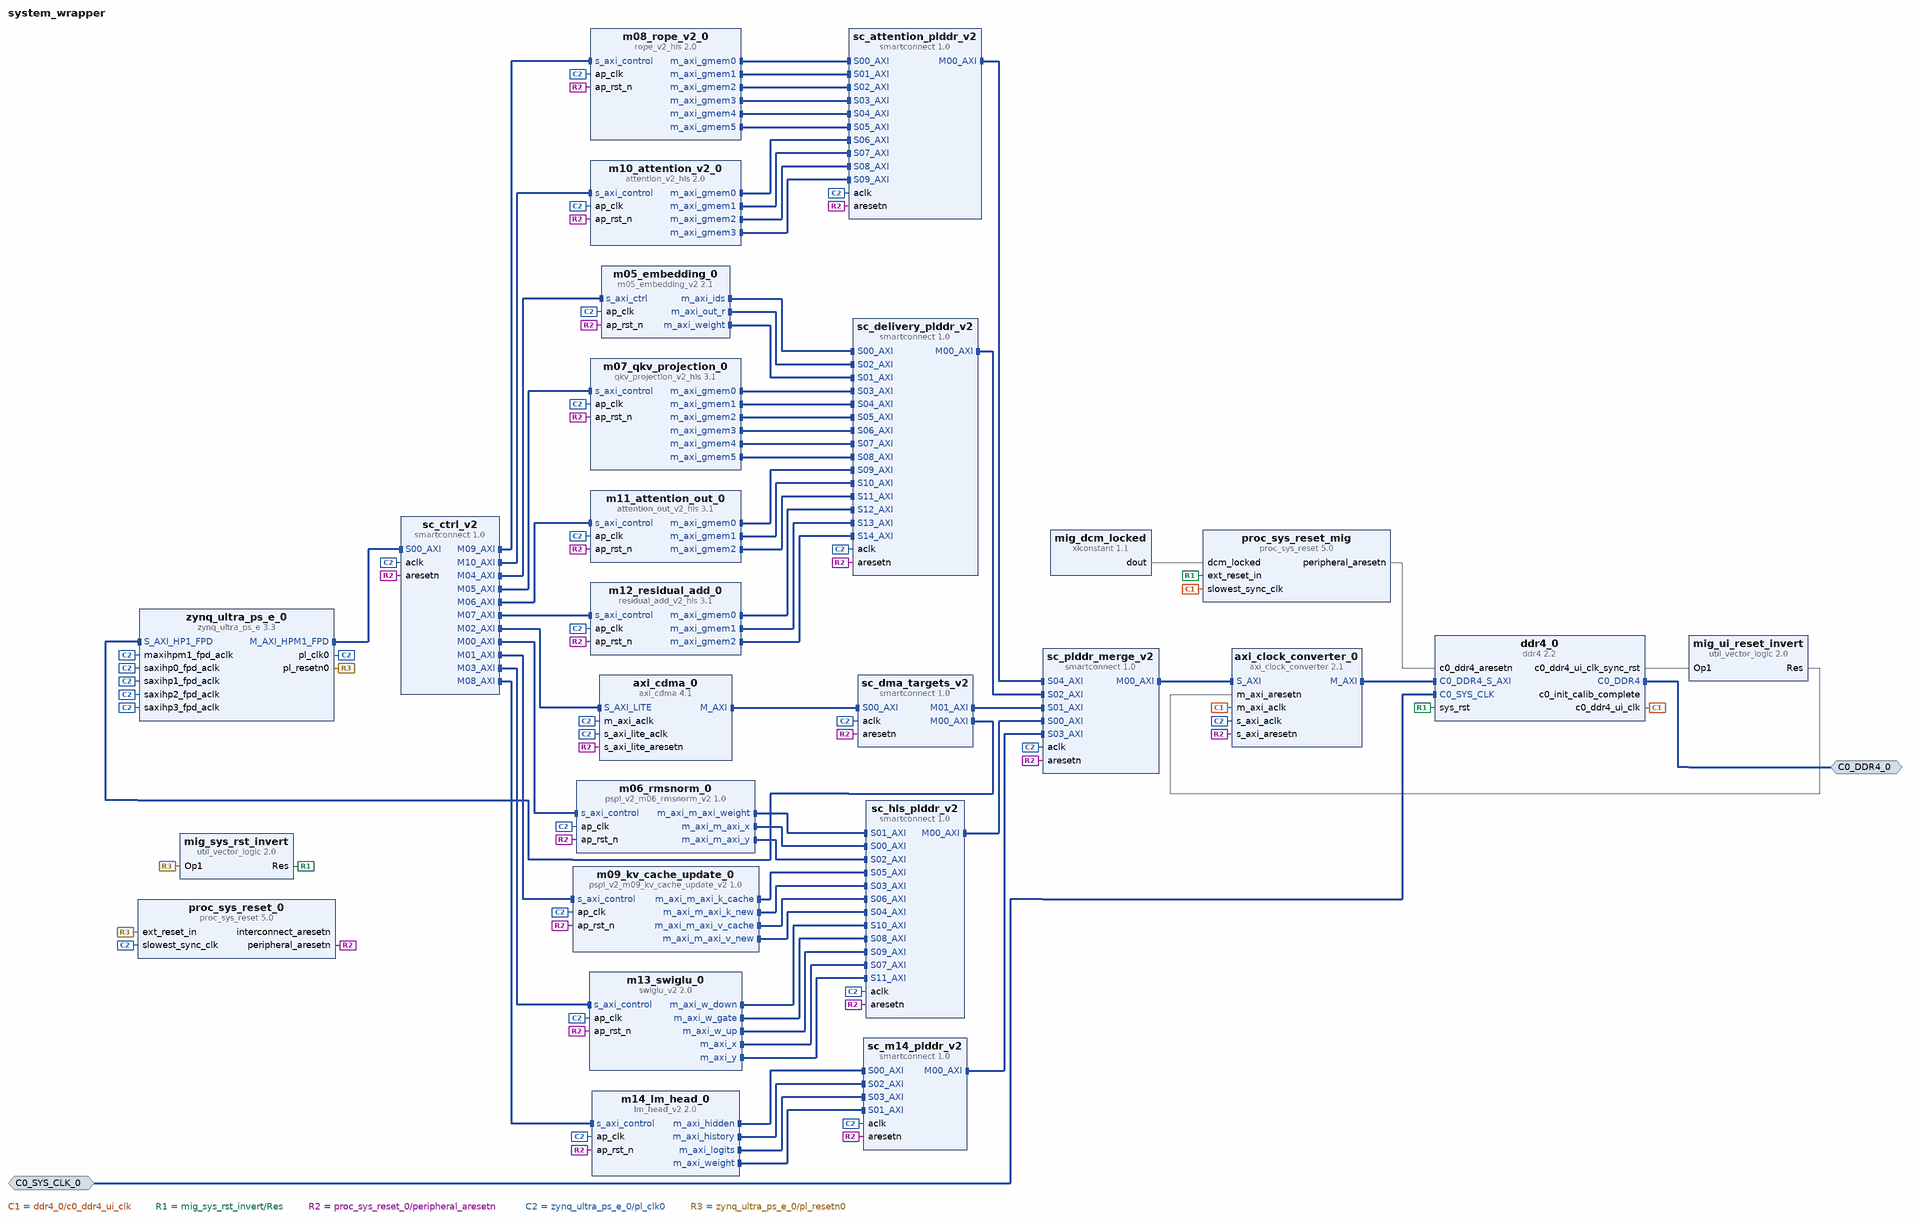
[diagram p0: block diagram of the top level]
# Vivado block design system_wrapper, xczu9eg-ffvb1156-2-i, Vivado 2021.1
create_bd_design system_wrapper

create_bd_intf_port -mode Slave -vlnv xilinx.com:interface:diff_clock_rtl:1.0 C0_SYS_CLK_0
set_property -dict {CONFIG.FREQ_HZ 200000000} [get_bd_intf_ports C0_SYS_CLK_0]
create_bd_intf_port -mode Master -vlnv xilinx.com:interface:ddr4_rtl:1.0 C0_DDR4_0

create_bd_cell -type ip -vlnv xilinx.com:ip:zynq_ultra_ps_e:3.3 zynq_ultra_ps_e_0
set_property -dict [list \
  CONFIG.CAN0_BOARD_INTERFACE custom \
  CONFIG.CAN1_BOARD_INTERFACE custom \
  CONFIG.CSU_BOARD_INTERFACE custom \
  CONFIG.DP_BOARD_INTERFACE custom \
  CONFIG.GEM0_BOARD_INTERFACE custom \
  CONFIG.GEM1_BOARD_INTERFACE custom \
  CONFIG.GEM2_BOARD_INTERFACE custom \
  CONFIG.GEM3_BOARD_INTERFACE custom \
  CONFIG.GPIO_BOARD_INTERFACE custom \
  CONFIG.IIC0_BOARD_INTERFACE custom \
  CONFIG.IIC1_BOARD_INTERFACE custom \
  CONFIG.NAND_BOARD_INTERFACE custom \
  CONFIG.PCIE_BOARD_INTERFACE custom \
  CONFIG.PJTAG_BOARD_INTERFACE custom \
  CONFIG.PMU_BOARD_INTERFACE custom \
  CONFIG.PSU_BANK_0_IO_STANDARD LVCMOS18 \
  CONFIG.PSU_BANK_1_IO_STANDARD LVCMOS18 \
  CONFIG.PSU_BANK_2_IO_STANDARD LVCMOS18 \
  CONFIG.PSU_BANK_3_IO_STANDARD LVCMOS33 \
  CONFIG.PSU_USB3__DUAL_CLOCK_ENABLE 0 \
  CONFIG.PSU__CAN1__PERIPHERAL__ENABLE 0 \
  CONFIG.PSU__CRF_APB__ACPU_CTRL__FREQMHZ 1333.333 \
  CONFIG.PSU__CRF_APB__ACPU_CTRL__SRCSEL APLL \
  CONFIG.PSU__CRF_APB__APLL_CTRL__SRCSEL PSS_REF_CLK \
  CONFIG.PSU__CRF_APB__DBG_FPD_CTRL__FREQMHZ 250 \
  CONFIG.PSU__CRF_APB__DBG_FPD_CTRL__SRCSEL IOPLL \
  CONFIG.PSU__CRF_APB__DBG_TRACE_CTRL__FREQMHZ 250 \
  CONFIG.PSU__CRF_APB__DBG_TRACE_CTRL__SRCSEL IOPLL \
  CONFIG.PSU__CRF_APB__DBG_TSTMP_CTRL__FREQMHZ 250 \
  CONFIG.PSU__CRF_APB__DBG_TSTMP_CTRL__SRCSEL IOPLL \
  CONFIG.PSU__CRF_APB__DDR_CTRL__FREQMHZ 800 \
  CONFIG.PSU__CRF_APB__DDR_CTRL__SRCSEL DPLL \
  CONFIG.PSU__CRF_APB__DPDMA_REF_CTRL__FREQMHZ 600 \
  CONFIG.PSU__CRF_APB__DPDMA_REF_CTRL__SRCSEL DPLL \
  CONFIG.PSU__CRF_APB__DPLL_CTRL__SRCSEL PSS_REF_CLK \
  CONFIG.PSU__CRF_APB__DP_AUDIO_REF_CTRL__SRCSEL VPLL \
  CONFIG.PSU__CRF_APB__DP_STC_REF_CTRL__SRCSEL VPLL \
  CONFIG.PSU__CRF_APB__DP_VIDEO_REF_CTRL__SRCSEL DPLL \
  CONFIG.PSU__CRF_APB__GDMA_REF_CTRL__FREQMHZ 600 \
  CONFIG.PSU__CRF_APB__GDMA_REF_CTRL__SRCSEL DPLL \
  CONFIG.PSU__CRF_APB__GPU_REF_CTRL__FREQMHZ 600 \
  CONFIG.PSU__CRF_APB__GPU_REF_CTRL__SRCSEL DPLL \
  CONFIG.PSU__CRF_APB__TOPSW_LSBUS_CTRL__FREQMHZ 100 \
  CONFIG.PSU__CRF_APB__TOPSW_LSBUS_CTRL__SRCSEL IOPLL \
  CONFIG.PSU__CRF_APB__TOPSW_MAIN_CTRL__FREQMHZ 533.333 \
  CONFIG.PSU__CRF_APB__TOPSW_MAIN_CTRL__SRCSEL VPLL \
  CONFIG.PSU__CRF_APB__VPLL_CTRL__SRCSEL PSS_REF_CLK \
  CONFIG.PSU__CRL_APB__ADMA_REF_CTRL__FREQMHZ 533.333 \
  CONFIG.PSU__CRL_APB__ADMA_REF_CTRL__SRCSEL RPLL \
  CONFIG.PSU__CRL_APB__CAN1_REF_CTRL__FREQMHZ 100 \
  CONFIG.PSU__CRL_APB__CAN1_REF_CTRL__SRCSEL IOPLL \
  CONFIG.PSU__CRL_APB__CPU_R5_CTRL__FREQMHZ 533.333 \
  CONFIG.PSU__CRL_APB__CPU_R5_CTRL__SRCSEL RPLL \
  CONFIG.PSU__CRL_APB__DBG_LPD_CTRL__FREQMHZ 250 \
  CONFIG.PSU__CRL_APB__DBG_LPD_CTRL__SRCSEL IOPLL \
  CONFIG.PSU__CRL_APB__GEM3_REF_CTRL__FREQMHZ 125 \
  CONFIG.PSU__CRL_APB__GEM3_REF_CTRL__SRCSEL IOPLL \
  CONFIG.PSU__CRL_APB__I2C0_REF_CTRL__FREQMHZ 100 \
  CONFIG.PSU__CRL_APB__I2C0_REF_CTRL__SRCSEL IOPLL \
  CONFIG.PSU__CRL_APB__I2C1_REF_CTRL__FREQMHZ 100 \
  CONFIG.PSU__CRL_APB__I2C1_REF_CTRL__SRCSEL IOPLL \
  CONFIG.PSU__CRL_APB__IOPLL_CTRL__SRCSEL PSS_REF_CLK \
  CONFIG.PSU__CRL_APB__IOU_SWITCH_CTRL__FREQMHZ 267 \
  CONFIG.PSU__CRL_APB__IOU_SWITCH_CTRL__SRCSEL RPLL \
  CONFIG.PSU__CRL_APB__LPD_LSBUS_CTRL__FREQMHZ 100 \
  CONFIG.PSU__CRL_APB__LPD_LSBUS_CTRL__SRCSEL IOPLL \
  CONFIG.PSU__CRL_APB__LPD_SWITCH_CTRL__FREQMHZ 533.333 \
  CONFIG.PSU__CRL_APB__LPD_SWITCH_CTRL__SRCSEL RPLL \
  CONFIG.PSU__CRL_APB__PCAP_CTRL__FREQMHZ 200 \
  CONFIG.PSU__CRL_APB__PCAP_CTRL__SRCSEL IOPLL \
  CONFIG.PSU__CRL_APB__PL0_REF_CTRL__FREQMHZ 100 \
  CONFIG.PSU__CRL_APB__PL0_REF_CTRL__SRCSEL DPLL \
  CONFIG.PSU__CRL_APB__QSPI_REF_CTRL__FREQMHZ 300 \
  CONFIG.PSU__CRL_APB__QSPI_REF_CTRL__SRCSEL IOPLL \
  CONFIG.PSU__CRL_APB__RPLL_CTRL__SRCSEL PSS_REF_CLK \
  CONFIG.PSU__CRL_APB__SDIO1_REF_CTRL__FREQMHZ 200 \
  CONFIG.PSU__CRL_APB__SDIO1_REF_CTRL__SRCSEL RPLL \
  CONFIG.PSU__CRL_APB__TIMESTAMP_REF_CTRL__FREQMHZ 100 \
  CONFIG.PSU__CRL_APB__TIMESTAMP_REF_CTRL__SRCSEL PSS_REF_CLK \
  CONFIG.PSU__CRL_APB__UART0_REF_CTRL__FREQMHZ 100 \
  CONFIG.PSU__CRL_APB__UART0_REF_CTRL__SRCSEL IOPLL \
  CONFIG.PSU__CRL_APB__UART1_REF_CTRL__FREQMHZ 100 \
  CONFIG.PSU__CRL_APB__UART1_REF_CTRL__SRCSEL IOPLL \
  CONFIG.PSU__CRL_APB__USB0_BUS_REF_CTRL__FREQMHZ 250 \
  CONFIG.PSU__CRL_APB__USB0_BUS_REF_CTRL__SRCSEL IOPLL \
  CONFIG.PSU__CRL_APB__USB3_DUAL_REF_CTRL__FREQMHZ 20 \
  CONFIG.PSU__CRL_APB__USB3_DUAL_REF_CTRL__SRCSEL IOPLL \
  CONFIG.PSU__CRL_APB__USB3__ENABLE 0 \
  CONFIG.PSU__CSUPMU__PERIPHERAL__VALID 0 \
  CONFIG.PSU__DDRC__BUS_WIDTH {64 Bit} \
  CONFIG.PSU__DDRC__COMPONENTS Components \
  CONFIG.PSU__DDRC__DEVICE_CAPACITY {8192 MBits} \
  CONFIG.PSU__DDRC__DRAM_WIDTH {16 Bits} \
  CONFIG.PSU__DDRC__ECC Disabled \
  CONFIG.PSU__DDRC__MEMORY_TYPE {DDR 4} \
  CONFIG.PSU__DDRC__SPEED_BIN DDR4_1600J \
  CONFIG.PSU__DDR_HIGH_ADDRESS_GUI_ENABLE 1 \
  CONFIG.PSU__DDR__INTERFACE__FREQMHZ 400.000 \
  CONFIG.PSU__DEVICE_TYPE EG \
  CONFIG.PSU__DISPLAYPORT__PERIPHERAL__ENABLE 0 \
  CONFIG.PSU__DLL__ISUSED 1 \
  CONFIG.PSU__ENET3__FIFO__ENABLE 0 \
  CONFIG.PSU__ENET3__GRP_MDIO__ENABLE 1 \
  CONFIG.PSU__ENET3__GRP_MDIO__IO {MIO 76 .. 77} \
  CONFIG.PSU__ENET3__PERIPHERAL__ENABLE 1 \
  CONFIG.PSU__ENET3__PERIPHERAL__IO {MIO 64 .. 75} \
  CONFIG.PSU__ENET3__PTP__ENABLE 0 \
  CONFIG.PSU__ENET3__TSU__ENABLE 0 \
  CONFIG.PSU__FPD_SLCR__WDT1__FREQMHZ 100 \
  CONFIG.PSU__FPGA_PL0_ENABLE 1 \
  CONFIG.PSU__GEM3_COHERENCY 0 \
  CONFIG.PSU__GEM3_ROUTE_THROUGH_FPD 0 \
  CONFIG.PSU__GEM__TSU__ENABLE 0 \
  CONFIG.PSU__GPIO0_MIO__PERIPHERAL__ENABLE 0 \
  CONFIG.PSU__GPIO1_MIO__PERIPHERAL__ENABLE 0 \
  CONFIG.PSU__I2C0__PERIPHERAL__ENABLE 0 \
  CONFIG.PSU__I2C1__PERIPHERAL__ENABLE 0 \
  CONFIG.PSU__IOU_SLCR__IOU_TTC_APB_CLK__TTC0_SEL APB \
  CONFIG.PSU__IOU_SLCR__IOU_TTC_APB_CLK__TTC1_SEL APB \
  CONFIG.PSU__IOU_SLCR__IOU_TTC_APB_CLK__TTC2_SEL APB \
  CONFIG.PSU__IOU_SLCR__IOU_TTC_APB_CLK__TTC3_SEL APB \
  CONFIG.PSU__IOU_SLCR__TTC1__FREQMHZ 100 \
  CONFIG.PSU__IOU_SLCR__TTC2__FREQMHZ 100 \
  CONFIG.PSU__IOU_SLCR__TTC3__FREQMHZ 100 \
  CONFIG.PSU__IOU_SLCR__WDT0__FREQMHZ 100 \
  CONFIG.PSU__LPD_SLCR__CSUPMU__FREQMHZ 100 \
  CONFIG.PSU__OVERRIDE_HPX_QOS 0 \
  CONFIG.PSU__OVERRIDE__BASIC_CLOCK 0 \
  CONFIG.PSU__PMU__PERIPHERAL__ENABLE 0 \
  CONFIG.PSU__PRESET_APPLIED 0 \
  CONFIG.PSU__PSS_REF_CLK__FREQMHZ 33.333 \
  CONFIG.PSU__QSPI__PERIPHERAL__ENABLE 0 \
  CONFIG.PSU__SATA__PERIPHERAL__ENABLE 0 \
  CONFIG.PSU__SD1_COHERENCY 0 \
  CONFIG.PSU__SD1_ROUTE_THROUGH_FPD 0 \
  CONFIG.PSU__SD1__DATA_TRANSFER_MODE 4Bit \
  CONFIG.PSU__SD1__GRP_CD__ENABLE 0 \
  CONFIG.PSU__SD1__GRP_POW__ENABLE 0 \
  CONFIG.PSU__SD1__GRP_WP__ENABLE 0 \
  CONFIG.PSU__SD1__PERIPHERAL__ENABLE 1 \
  CONFIG.PSU__SD1__PERIPHERAL__IO {MIO 46 .. 51} \
  CONFIG.PSU__SD1__SLOT_TYPE {SD 2.0} \
  CONFIG.PSU__SWDT0__PERIPHERAL__ENABLE 0 \
  CONFIG.PSU__SWDT1__PERIPHERAL__ENABLE 0 \
  CONFIG.PSU__TSU__BUFG_PORT_PAIR 0 \
  CONFIG.PSU__TTC0__CLOCK__ENABLE 0 \
  CONFIG.PSU__TTC0__PERIPHERAL__ENABLE 1 \
  CONFIG.PSU__TTC0__WAVEOUT__ENABLE 0 \
  CONFIG.PSU__TTC1__PERIPHERAL__ENABLE 0 \
  CONFIG.PSU__TTC2__PERIPHERAL__ENABLE 0 \
  CONFIG.PSU__TTC3__PERIPHERAL__ENABLE 0 \
  CONFIG.PSU__UART0__PERIPHERAL__ENABLE 0 \
  CONFIG.PSU__UART1__PERIPHERAL__ENABLE 0 \
  CONFIG.PSU__USB0__PERIPHERAL__ENABLE 0 \
  CONFIG.PSU__USE__IRQ0 0 \
  CONFIG.PSU__USE__M_AXI_GP0 0 \
  CONFIG.PSU__USE__M_AXI_GP1 1 \
  CONFIG.PSU__USE__M_AXI_GP2 0 \
  CONFIG.PSU__USE__S_AXI_GP2 1 \
  CONFIG.PSU__USE__S_AXI_GP3 1 \
  CONFIG.PSU__USE__S_AXI_GP4 1 \
  CONFIG.PSU__USE__S_AXI_GP5 1 \
  CONFIG.QSPI_BOARD_INTERFACE custom \
  CONFIG.SATA_BOARD_INTERFACE custom \
  CONFIG.SD0_BOARD_INTERFACE custom \
  CONFIG.SD1_BOARD_INTERFACE custom \
  CONFIG.SPI0_BOARD_INTERFACE custom \
  CONFIG.SPI1_BOARD_INTERFACE custom \
  CONFIG.SUBPRESET1 Custom \
  CONFIG.SUBPRESET2 Custom \
  CONFIG.SWDT0_BOARD_INTERFACE custom \
  CONFIG.SWDT1_BOARD_INTERFACE custom \
  CONFIG.TRACE_BOARD_INTERFACE custom \
  CONFIG.TTC0_BOARD_INTERFACE custom \
  CONFIG.TTC1_BOARD_INTERFACE custom \
  CONFIG.TTC2_BOARD_INTERFACE custom \
  CONFIG.TTC3_BOARD_INTERFACE custom \
  CONFIG.UART0_BOARD_INTERFACE custom \
  CONFIG.UART1_BOARD_INTERFACE custom \
  CONFIG.USB0_BOARD_INTERFACE custom \
  CONFIG.USB1_BOARD_INTERFACE custom \
  CONFIG.preset None \
] [get_bd_cells zynq_ultra_ps_e_0]
# 738 more settings of zynq_ultra_ps_e_0 are not shown: defaults, MIO pin electricals, DDR timing, and values the tool derives
create_bd_cell -type ip -vlnv xilinx.com:ip:proc_sys_reset:5.0 proc_sys_reset_0
create_bd_cell -type ip -vlnv xilinx.com:ip:ddr4:2.2 ddr4_0
set_property -dict [list \
  CONFIG.C0.BANK_GROUP_WIDTH 1 \
  CONFIG.C0.DDR4_AxiAddressWidth 31 \
  CONFIG.C0.DDR4_AxiDataWidth 128 \
  CONFIG.C0.DDR4_CasLatency 15 \
  CONFIG.C0.DDR4_DataWidth 32 \
  CONFIG.C0.DDR4_InputClockPeriod 5003 \
  CONFIG.C0.DDR4_MemoryPart MT40A512M16LY-075 \
  CONFIG.C0.DDR4_TimePeriod 938 \
] [get_bd_cells ddr4_0]
create_bd_cell -type ip -vlnv xilinx.com:ip:axi_clock_converter:2.1 axi_clock_converter_0
create_bd_cell -type ip -vlnv xilinx.com:ip:util_vector_logic:2.0 mig_sys_rst_invert
set_property -dict {CONFIG.C_OPERATION not CONFIG.C_SIZE 1} [get_bd_cells mig_sys_rst_invert]
create_bd_cell -type ip -vlnv xilinx.com:ip:util_vector_logic:2.0 mig_ui_reset_invert
set_property -dict {CONFIG.C_OPERATION not CONFIG.C_SIZE 1} [get_bd_cells mig_ui_reset_invert]
create_bd_cell -type ip -vlnv xilinx.com:ip:proc_sys_reset:5.0 proc_sys_reset_mig
create_bd_cell -type ip -vlnv xilinx.com:ip:xlconstant:1.1 mig_dcm_locked
set_property -dict {CONFIG.CONST_VAL 1 CONFIG.CONST_WIDTH 1} [get_bd_cells mig_dcm_locked]
create_bd_cell -type ip -vlnv xilinx.com:ip:smartconnect:1.0 sc_ctrl_v2
set_property -dict {CONFIG.NUM_MI 11 CONFIG.NUM_SI 1} [get_bd_cells sc_ctrl_v2]
create_bd_cell -type ip -vlnv xilinx.com:ip:axi_cdma:4.1 axi_cdma_0
set_property -dict [list \
  CONFIG.C_ADDR_WIDTH 32 \
  CONFIG.C_INCLUDE_DRE 0 \
  CONFIG.C_INCLUDE_SG 0 \
  CONFIG.C_M_AXI_DATA_WIDTH 128 \
  CONFIG.C_M_AXI_MAX_BURST_LEN 64 \
] [get_bd_cells axi_cdma_0]
create_bd_cell -type ip -vlnv xilinx.com:ip:smartconnect:1.0 sc_dma_targets_v2
set_property -dict {CONFIG.NUM_MI 2 CONFIG.NUM_SI 1} [get_bd_cells sc_dma_targets_v2]
create_bd_cell -type ip -vlnv xilinx.com:ip:smartconnect:1.0 sc_hls_plddr_v2
set_property -dict {CONFIG.NUM_MI 1 CONFIG.NUM_SI 12} [get_bd_cells sc_hls_plddr_v2]
create_bd_cell -type ip -vlnv xilinx.com:ip:smartconnect:1.0 sc_plddr_merge_v2
set_property -dict {CONFIG.NUM_MI 1 CONFIG.NUM_SI 5} [get_bd_cells sc_plddr_merge_v2]
create_bd_cell -type ip -vlnv xilinx.com:hls:pspl_v2_m06_rmsnorm_v2:1.0 m06_rmsnorm_0
create_bd_cell -type ip -vlnv xilinx.com:hls:pspl_v2_m09_kv_cache_update_v2:1.0 m09_kv_cache_update_0
create_bd_cell -type ip -vlnv xilinx.com:ip:smartconnect:1.0 sc_delivery_plddr_v2
set_property -dict {CONFIG.NUM_MI 1 CONFIG.NUM_SI 15} [get_bd_cells sc_delivery_plddr_v2]
create_bd_cell -type ip -vlnv llm-fpga.local:user:m05_embedding_v2:2.1 m05_embedding_0
create_bd_cell -type ip -vlnv xilinx.com:hls:residual_add_v2_hls:3.1 m12_residual_add_0
create_bd_cell -type ip -vlnv xilinx.com:ip:smartconnect:1.0 sc_m14_plddr_v2
set_property -dict {CONFIG.NUM_MI 1 CONFIG.NUM_SI 4} [get_bd_cells sc_m14_plddr_v2]
create_bd_cell -type ip -vlnv user.org:llm_fpga:lm_head_v2:2.0 m14_lm_head_0
create_bd_cell -type ip -vlnv xilinx.com:hls:qkv_projection_v2_hls:3.1 m07_qkv_projection_0
create_bd_cell -type ip -vlnv xilinx.com:hls:attention_out_v2_hls:3.1 m11_attention_out_0
create_bd_cell -type ip -vlnv xilinx.com:ip:smartconnect:1.0 sc_attention_plddr_v2
set_property -dict {CONFIG.NUM_MI 1 CONFIG.NUM_SI 10} [get_bd_cells sc_attention_plddr_v2]
create_bd_cell -type ip -vlnv xilinx.com:hls:rope_v2_hls:2.0 m08_rope_v2_0
create_bd_cell -type ip -vlnv xilinx.com:hls:attention_v2_hls:2.0 m10_attention_v2_0
create_bd_cell -type ip -vlnv user.org:hls:swiglu_v2:2.0 m13_swiglu_0

# ---- connections ----

connect_bd_intf_net -intf_net C0_SYS_CLK_0_1 [get_bd_intf_ports C0_SYS_CLK_0] [get_bd_intf_pins ddr4_0/C0_SYS_CLK]
connect_bd_intf_net [get_bd_intf_pins axi_cdma_0/M_AXI] [get_bd_intf_pins sc_dma_targets_v2/S00_AXI]
connect_bd_intf_net [get_bd_intf_pins axi_clock_converter_0/M_AXI] [get_bd_intf_pins ddr4_0/C0_DDR4_S_AXI]
connect_bd_intf_net [get_bd_intf_ports C0_DDR4_0] [get_bd_intf_pins ddr4_0/C0_DDR4]
connect_bd_intf_net [get_bd_intf_pins m05_embedding_0/m_axi_ids] [get_bd_intf_pins sc_delivery_plddr_v2/S00_AXI]
connect_bd_intf_net [get_bd_intf_pins m05_embedding_0/m_axi_out_r] [get_bd_intf_pins sc_delivery_plddr_v2/S02_AXI]
connect_bd_intf_net [get_bd_intf_pins m05_embedding_0/m_axi_weight] [get_bd_intf_pins sc_delivery_plddr_v2/S01_AXI]
connect_bd_intf_net [get_bd_intf_pins m06_rmsnorm_0/m_axi_m_axi_weight] [get_bd_intf_pins sc_hls_plddr_v2/S01_AXI]
connect_bd_intf_net [get_bd_intf_pins m06_rmsnorm_0/m_axi_m_axi_x] [get_bd_intf_pins sc_hls_plddr_v2/S00_AXI]
connect_bd_intf_net [get_bd_intf_pins m06_rmsnorm_0/m_axi_m_axi_y] [get_bd_intf_pins sc_hls_plddr_v2/S02_AXI]
connect_bd_intf_net [get_bd_intf_pins m07_qkv_projection_0/m_axi_gmem0] [get_bd_intf_pins sc_delivery_plddr_v2/S03_AXI]
connect_bd_intf_net [get_bd_intf_pins m07_qkv_projection_0/m_axi_gmem1] [get_bd_intf_pins sc_delivery_plddr_v2/S04_AXI]
connect_bd_intf_net [get_bd_intf_pins m07_qkv_projection_0/m_axi_gmem2] [get_bd_intf_pins sc_delivery_plddr_v2/S05_AXI]
connect_bd_intf_net [get_bd_intf_pins m07_qkv_projection_0/m_axi_gmem3] [get_bd_intf_pins sc_delivery_plddr_v2/S06_AXI]
connect_bd_intf_net [get_bd_intf_pins m07_qkv_projection_0/m_axi_gmem4] [get_bd_intf_pins sc_delivery_plddr_v2/S07_AXI]
connect_bd_intf_net [get_bd_intf_pins m07_qkv_projection_0/m_axi_gmem5] [get_bd_intf_pins sc_delivery_plddr_v2/S08_AXI]
connect_bd_intf_net [get_bd_intf_pins m08_rope_v2_0/m_axi_gmem0] [get_bd_intf_pins sc_attention_plddr_v2/S00_AXI]
connect_bd_intf_net [get_bd_intf_pins m08_rope_v2_0/m_axi_gmem1] [get_bd_intf_pins sc_attention_plddr_v2/S01_AXI]
connect_bd_intf_net [get_bd_intf_pins m08_rope_v2_0/m_axi_gmem2] [get_bd_intf_pins sc_attention_plddr_v2/S02_AXI]
connect_bd_intf_net [get_bd_intf_pins m08_rope_v2_0/m_axi_gmem3] [get_bd_intf_pins sc_attention_plddr_v2/S03_AXI]
connect_bd_intf_net [get_bd_intf_pins m08_rope_v2_0/m_axi_gmem4] [get_bd_intf_pins sc_attention_plddr_v2/S04_AXI]
connect_bd_intf_net [get_bd_intf_pins m08_rope_v2_0/m_axi_gmem5] [get_bd_intf_pins sc_attention_plddr_v2/S05_AXI]
connect_bd_intf_net [get_bd_intf_pins m09_kv_cache_update_0/m_axi_m_axi_k_cache] [get_bd_intf_pins sc_hls_plddr_v2/S05_AXI]
connect_bd_intf_net [get_bd_intf_pins m09_kv_cache_update_0/m_axi_m_axi_k_new] [get_bd_intf_pins sc_hls_plddr_v2/S03_AXI]
connect_bd_intf_net [get_bd_intf_pins m09_kv_cache_update_0/m_axi_m_axi_v_cache] [get_bd_intf_pins sc_hls_plddr_v2/S06_AXI]
connect_bd_intf_net [get_bd_intf_pins m09_kv_cache_update_0/m_axi_m_axi_v_new] [get_bd_intf_pins sc_hls_plddr_v2/S04_AXI]
connect_bd_intf_net [get_bd_intf_pins m10_attention_v2_0/m_axi_gmem0] [get_bd_intf_pins sc_attention_plddr_v2/S06_AXI]
connect_bd_intf_net [get_bd_intf_pins m10_attention_v2_0/m_axi_gmem1] [get_bd_intf_pins sc_attention_plddr_v2/S07_AXI]
connect_bd_intf_net [get_bd_intf_pins m10_attention_v2_0/m_axi_gmem2] [get_bd_intf_pins sc_attention_plddr_v2/S08_AXI]
connect_bd_intf_net [get_bd_intf_pins m10_attention_v2_0/m_axi_gmem3] [get_bd_intf_pins sc_attention_plddr_v2/S09_AXI]
connect_bd_intf_net [get_bd_intf_pins m11_attention_out_0/m_axi_gmem0] [get_bd_intf_pins sc_delivery_plddr_v2/S09_AXI]
connect_bd_intf_net [get_bd_intf_pins m11_attention_out_0/m_axi_gmem1] [get_bd_intf_pins sc_delivery_plddr_v2/S10_AXI]
connect_bd_intf_net [get_bd_intf_pins m11_attention_out_0/m_axi_gmem2] [get_bd_intf_pins sc_delivery_plddr_v2/S11_AXI]
connect_bd_intf_net [get_bd_intf_pins m12_residual_add_0/m_axi_gmem0] [get_bd_intf_pins sc_delivery_plddr_v2/S12_AXI]
connect_bd_intf_net [get_bd_intf_pins m12_residual_add_0/m_axi_gmem1] [get_bd_intf_pins sc_delivery_plddr_v2/S13_AXI]
connect_bd_intf_net [get_bd_intf_pins m12_residual_add_0/m_axi_gmem2] [get_bd_intf_pins sc_delivery_plddr_v2/S14_AXI]
connect_bd_intf_net [get_bd_intf_pins m13_swiglu_0/m_axi_w_down] [get_bd_intf_pins sc_hls_plddr_v2/S10_AXI]
connect_bd_intf_net [get_bd_intf_pins m13_swiglu_0/m_axi_w_gate] [get_bd_intf_pins sc_hls_plddr_v2/S08_AXI]
connect_bd_intf_net [get_bd_intf_pins m13_swiglu_0/m_axi_w_up] [get_bd_intf_pins sc_hls_plddr_v2/S09_AXI]
connect_bd_intf_net [get_bd_intf_pins m13_swiglu_0/m_axi_x] [get_bd_intf_pins sc_hls_plddr_v2/S07_AXI]
connect_bd_intf_net [get_bd_intf_pins m13_swiglu_0/m_axi_y] [get_bd_intf_pins sc_hls_plddr_v2/S11_AXI]
connect_bd_intf_net [get_bd_intf_pins m14_lm_head_0/m_axi_hidden] [get_bd_intf_pins sc_m14_plddr_v2/S00_AXI]
connect_bd_intf_net [get_bd_intf_pins m14_lm_head_0/m_axi_history] [get_bd_intf_pins sc_m14_plddr_v2/S02_AXI]
connect_bd_intf_net [get_bd_intf_pins m14_lm_head_0/m_axi_logits] [get_bd_intf_pins sc_m14_plddr_v2/S03_AXI]
connect_bd_intf_net [get_bd_intf_pins m14_lm_head_0/m_axi_weight] [get_bd_intf_pins sc_m14_plddr_v2/S01_AXI]
connect_bd_intf_net -intf_net qkvupdate_smartconnect_plddr_M00_AXI [get_bd_intf_pins sc_plddr_merge_v2/M00_AXI] [get_bd_intf_pins axi_clock_converter_0/S_AXI]
connect_bd_intf_net -intf_net qkvupdate_smartconnect_psddr_M00_AXI [get_bd_intf_pins sc_dma_targets_v2/M00_AXI] [get_bd_intf_pins zynq_ultra_ps_e_0/S_AXI_HP1_FPD]
connect_bd_intf_net [get_bd_intf_pins sc_attention_plddr_v2/M00_AXI] [get_bd_intf_pins sc_plddr_merge_v2/S04_AXI]
connect_bd_intf_net [get_bd_intf_pins sc_ctrl_v2/M00_AXI] [get_bd_intf_pins m06_rmsnorm_0/s_axi_control]
connect_bd_intf_net [get_bd_intf_pins sc_ctrl_v2/M01_AXI] [get_bd_intf_pins m09_kv_cache_update_0/s_axi_control]
connect_bd_intf_net [get_bd_intf_pins sc_ctrl_v2/M02_AXI] [get_bd_intf_pins axi_cdma_0/S_AXI_LITE]
connect_bd_intf_net [get_bd_intf_pins m13_swiglu_0/s_axi_control] [get_bd_intf_pins sc_ctrl_v2/M03_AXI]
connect_bd_intf_net [get_bd_intf_pins sc_ctrl_v2/M04_AXI] [get_bd_intf_pins m05_embedding_0/s_axi_ctrl]
connect_bd_intf_net [get_bd_intf_pins sc_ctrl_v2/M05_AXI] [get_bd_intf_pins m07_qkv_projection_0/s_axi_control]
connect_bd_intf_net [get_bd_intf_pins sc_ctrl_v2/M06_AXI] [get_bd_intf_pins m11_attention_out_0/s_axi_control]
connect_bd_intf_net [get_bd_intf_pins sc_ctrl_v2/M07_AXI] [get_bd_intf_pins m12_residual_add_0/s_axi_control]
connect_bd_intf_net [get_bd_intf_pins sc_ctrl_v2/M08_AXI] [get_bd_intf_pins m14_lm_head_0/s_axi_control]
connect_bd_intf_net [get_bd_intf_pins sc_ctrl_v2/M09_AXI] [get_bd_intf_pins m08_rope_v2_0/s_axi_control]
connect_bd_intf_net [get_bd_intf_pins sc_ctrl_v2/M10_AXI] [get_bd_intf_pins m10_attention_v2_0/s_axi_control]
connect_bd_intf_net [get_bd_intf_pins sc_delivery_plddr_v2/M00_AXI] [get_bd_intf_pins sc_plddr_merge_v2/S02_AXI]
connect_bd_intf_net [get_bd_intf_pins sc_dma_targets_v2/M01_AXI] [get_bd_intf_pins sc_plddr_merge_v2/S01_AXI]
connect_bd_intf_net [get_bd_intf_pins sc_hls_plddr_v2/M00_AXI] [get_bd_intf_pins sc_plddr_merge_v2/S00_AXI]
connect_bd_intf_net [get_bd_intf_pins sc_m14_plddr_v2/M00_AXI] [get_bd_intf_pins sc_plddr_merge_v2/S03_AXI]
connect_bd_intf_net [get_bd_intf_pins zynq_ultra_ps_e_0/M_AXI_HPM1_FPD] [get_bd_intf_pins sc_ctrl_v2/S00_AXI]
connect_bd_net [get_bd_pins ddr4_0/c0_ddr4_ui_clk] [get_bd_pins axi_clock_converter_0/m_axi_aclk] [get_bd_pins proc_sys_reset_mig/slowest_sync_clk]
connect_bd_net [get_bd_pins ddr4_0/c0_ddr4_ui_clk_sync_rst] [get_bd_pins mig_ui_reset_invert/Op1]
# net ddr4_0_c0_init_calib_complete has one end: ddr4_0/c0_init_calib_complete
connect_bd_net [get_bd_pins mig_dcm_locked/dout] [get_bd_pins proc_sys_reset_mig/dcm_locked]
connect_bd_net [get_bd_pins mig_sys_rst_invert/Res] [get_bd_pins ddr4_0/sys_rst] [get_bd_pins proc_sys_reset_mig/ext_reset_in]
connect_bd_net [get_bd_pins mig_ui_reset_invert/Res] [get_bd_pins axi_clock_converter_0/m_axi_aresetn]
# net proc_sys_reset_0_interconnect_aresetn has one end: proc_sys_reset_0/interconnect_aresetn
connect_bd_net [get_bd_pins proc_sys_reset_0/peripheral_aresetn] \
  [get_bd_pins axi_clock_converter_0/s_axi_aresetn] [get_bd_pins sc_ctrl_v2/aresetn] [get_bd_pins sc_dma_targets_v2/aresetn] \
  [get_bd_pins sc_hls_plddr_v2/aresetn] [get_bd_pins sc_plddr_merge_v2/aresetn] [get_bd_pins axi_cdma_0/s_axi_lite_aresetn] \
  [get_bd_pins m06_rmsnorm_0/ap_rst_n] [get_bd_pins m09_kv_cache_update_0/ap_rst_n] \
  [get_bd_pins sc_delivery_plddr_v2/aresetn] [get_bd_pins m05_embedding_0/ap_rst_n] [get_bd_pins m12_residual_add_0/ap_rst_n] \
  [get_bd_pins sc_m14_plddr_v2/aresetn] [get_bd_pins m14_lm_head_0/ap_rst_n] [get_bd_pins m07_qkv_projection_0/ap_rst_n] \
  [get_bd_pins m11_attention_out_0/ap_rst_n] [get_bd_pins sc_attention_plddr_v2/aresetn] [get_bd_pins m08_rope_v2_0/ap_rst_n] \
  [get_bd_pins m10_attention_v2_0/ap_rst_n] [get_bd_pins m13_swiglu_0/ap_rst_n]
connect_bd_net [get_bd_pins proc_sys_reset_mig/peripheral_aresetn] [get_bd_pins ddr4_0/c0_ddr4_aresetn]
connect_bd_net [get_bd_pins zynq_ultra_ps_e_0/pl_clk0] \
  [get_bd_pins zynq_ultra_ps_e_0/saxihp0_fpd_aclk] [get_bd_pins proc_sys_reset_0/slowest_sync_clk] \
  [get_bd_pins axi_clock_converter_0/s_axi_aclk] [get_bd_pins zynq_ultra_ps_e_0/maxihpm1_fpd_aclk] \
  [get_bd_pins zynq_ultra_ps_e_0/saxihp1_fpd_aclk] [get_bd_pins zynq_ultra_ps_e_0/saxihp2_fpd_aclk] \
  [get_bd_pins zynq_ultra_ps_e_0/saxihp3_fpd_aclk] [get_bd_pins sc_ctrl_v2/aclk] [get_bd_pins sc_dma_targets_v2/aclk] \
  [get_bd_pins sc_hls_plddr_v2/aclk] [get_bd_pins sc_plddr_merge_v2/aclk] [get_bd_pins axi_cdma_0/m_axi_aclk] \
  [get_bd_pins axi_cdma_0/s_axi_lite_aclk] [get_bd_pins m06_rmsnorm_0/ap_clk] [get_bd_pins m09_kv_cache_update_0/ap_clk] \
  [get_bd_pins sc_delivery_plddr_v2/aclk] [get_bd_pins m05_embedding_0/ap_clk] [get_bd_pins m12_residual_add_0/ap_clk] \
  [get_bd_pins sc_m14_plddr_v2/aclk] [get_bd_pins m14_lm_head_0/ap_clk] [get_bd_pins m07_qkv_projection_0/ap_clk] \
  [get_bd_pins m11_attention_out_0/ap_clk] [get_bd_pins sc_attention_plddr_v2/aclk] [get_bd_pins m08_rope_v2_0/ap_clk] \
  [get_bd_pins m10_attention_v2_0/ap_clk] [get_bd_pins m13_swiglu_0/ap_clk]
connect_bd_net [get_bd_pins zynq_ultra_ps_e_0/pl_resetn0] [get_bd_pins proc_sys_reset_0/ext_reset_in] [get_bd_pins mig_sys_rst_invert/Op1]

# ---- address map ----
assign_bd_address -offset 0x00000000 -range 2G -target_address_space [get_bd_addr_spaces axi_cdma_0/Data] [get_bd_addr_segs zynq_ultra_ps_e_0/SAXIGP3/HP1_DDR_LOW]
assign_bd_address -offset 0x80000000 -range 1G -target_address_space [get_bd_addr_spaces axi_cdma_0/Data] [get_bd_addr_segs ddr4_0/C0_DDR4_MEMORY_MAP/C0_DDR4_ADDRESS_BLOCK]
exclude_bd_addr_seg -offset 0x00000000 -range 1 -target_address_space [get_bd_addr_spaces axi_cdma_0/Data] [get_bd_addr_segs zynq_ultra_ps_e_0/SAXIGP3/HP1_DDR_HIGH]
exclude_bd_addr_seg -offset 0xFF000000 -range 16M -target_address_space [get_bd_addr_spaces axi_cdma_0/Data] [get_bd_addr_segs zynq_ultra_ps_e_0/SAXIGP3/HP1_LPS_OCM]
assign_bd_address -offset 0x0000000080000000 -range 1G -target_address_space [get_bd_addr_spaces m05_embedding_0/Data_m_axi_ids] [get_bd_addr_segs ddr4_0/C0_DDR4_MEMORY_MAP/C0_DDR4_ADDRESS_BLOCK]
assign_bd_address -offset 0x0000000080000000 -range 1G -target_address_space [get_bd_addr_spaces m05_embedding_0/Data_m_axi_out_r] [get_bd_addr_segs ddr4_0/C0_DDR4_MEMORY_MAP/C0_DDR4_ADDRESS_BLOCK]
assign_bd_address -offset 0x0000000080000000 -range 1G -target_address_space [get_bd_addr_spaces m05_embedding_0/Data_m_axi_weight] [get_bd_addr_segs ddr4_0/C0_DDR4_MEMORY_MAP/C0_DDR4_ADDRESS_BLOCK]
assign_bd_address -offset 0x0000000080000000 -range 1G -target_address_space [get_bd_addr_spaces m06_rmsnorm_0/Data_m_axi_m_axi_weight] [get_bd_addr_segs ddr4_0/C0_DDR4_MEMORY_MAP/C0_DDR4_ADDRESS_BLOCK]
assign_bd_address -offset 0x0000000080000000 -range 1G -target_address_space [get_bd_addr_spaces m06_rmsnorm_0/Data_m_axi_m_axi_x] [get_bd_addr_segs ddr4_0/C0_DDR4_MEMORY_MAP/C0_DDR4_ADDRESS_BLOCK]
assign_bd_address -offset 0x0000000080000000 -range 1G -target_address_space [get_bd_addr_spaces m06_rmsnorm_0/Data_m_axi_m_axi_y] [get_bd_addr_segs ddr4_0/C0_DDR4_MEMORY_MAP/C0_DDR4_ADDRESS_BLOCK]
assign_bd_address -offset 0x0000000080000000 -range 1G -target_address_space [get_bd_addr_spaces m07_qkv_projection_0/Data_m_axi_gmem0] [get_bd_addr_segs ddr4_0/C0_DDR4_MEMORY_MAP/C0_DDR4_ADDRESS_BLOCK]
assign_bd_address -offset 0x0000000080000000 -range 1G -target_address_space [get_bd_addr_spaces m07_qkv_projection_0/Data_m_axi_gmem1] [get_bd_addr_segs ddr4_0/C0_DDR4_MEMORY_MAP/C0_DDR4_ADDRESS_BLOCK]
assign_bd_address -offset 0x0000000080000000 -range 1G -target_address_space [get_bd_addr_spaces m07_qkv_projection_0/Data_m_axi_gmem2] [get_bd_addr_segs ddr4_0/C0_DDR4_MEMORY_MAP/C0_DDR4_ADDRESS_BLOCK]
assign_bd_address -offset 0x0000000080000000 -range 1G -target_address_space [get_bd_addr_spaces m07_qkv_projection_0/Data_m_axi_gmem3] [get_bd_addr_segs ddr4_0/C0_DDR4_MEMORY_MAP/C0_DDR4_ADDRESS_BLOCK]
assign_bd_address -offset 0x0000000080000000 -range 1G -target_address_space [get_bd_addr_spaces m07_qkv_projection_0/Data_m_axi_gmem4] [get_bd_addr_segs ddr4_0/C0_DDR4_MEMORY_MAP/C0_DDR4_ADDRESS_BLOCK]
assign_bd_address -offset 0x0000000080000000 -range 1G -target_address_space [get_bd_addr_spaces m07_qkv_projection_0/Data_m_axi_gmem5] [get_bd_addr_segs ddr4_0/C0_DDR4_MEMORY_MAP/C0_DDR4_ADDRESS_BLOCK]
assign_bd_address -offset 0x0000000080000000 -range 1G -target_address_space [get_bd_addr_spaces m08_rope_v2_0/Data_m_axi_gmem0] [get_bd_addr_segs ddr4_0/C0_DDR4_MEMORY_MAP/C0_DDR4_ADDRESS_BLOCK]
assign_bd_address -offset 0x0000000080000000 -range 1G -target_address_space [get_bd_addr_spaces m08_rope_v2_0/Data_m_axi_gmem1] [get_bd_addr_segs ddr4_0/C0_DDR4_MEMORY_MAP/C0_DDR4_ADDRESS_BLOCK]
assign_bd_address -offset 0x0000000080000000 -range 1G -target_address_space [get_bd_addr_spaces m08_rope_v2_0/Data_m_axi_gmem2] [get_bd_addr_segs ddr4_0/C0_DDR4_MEMORY_MAP/C0_DDR4_ADDRESS_BLOCK]
assign_bd_address -offset 0x0000000080000000 -range 1G -target_address_space [get_bd_addr_spaces m08_rope_v2_0/Data_m_axi_gmem3] [get_bd_addr_segs ddr4_0/C0_DDR4_MEMORY_MAP/C0_DDR4_ADDRESS_BLOCK]
assign_bd_address -offset 0x0000000080000000 -range 1G -target_address_space [get_bd_addr_spaces m08_rope_v2_0/Data_m_axi_gmem4] [get_bd_addr_segs ddr4_0/C0_DDR4_MEMORY_MAP/C0_DDR4_ADDRESS_BLOCK]
assign_bd_address -offset 0x0000000080000000 -range 1G -target_address_space [get_bd_addr_spaces m08_rope_v2_0/Data_m_axi_gmem5] [get_bd_addr_segs ddr4_0/C0_DDR4_MEMORY_MAP/C0_DDR4_ADDRESS_BLOCK]
assign_bd_address -offset 0x0000000080000000 -range 1G -target_address_space [get_bd_addr_spaces m09_kv_cache_update_0/Data_m_axi_m_axi_k_cache] [get_bd_addr_segs ddr4_0/C0_DDR4_MEMORY_MAP/C0_DDR4_ADDRESS_BLOCK]
assign_bd_address -offset 0x0000000080000000 -range 1G -target_address_space [get_bd_addr_spaces m09_kv_cache_update_0/Data_m_axi_m_axi_k_new] [get_bd_addr_segs ddr4_0/C0_DDR4_MEMORY_MAP/C0_DDR4_ADDRESS_BLOCK]
assign_bd_address -offset 0x0000000080000000 -range 1G -target_address_space [get_bd_addr_spaces m09_kv_cache_update_0/Data_m_axi_m_axi_v_cache] [get_bd_addr_segs ddr4_0/C0_DDR4_MEMORY_MAP/C0_DDR4_ADDRESS_BLOCK]
assign_bd_address -offset 0x0000000080000000 -range 1G -target_address_space [get_bd_addr_spaces m09_kv_cache_update_0/Data_m_axi_m_axi_v_new] [get_bd_addr_segs ddr4_0/C0_DDR4_MEMORY_MAP/C0_DDR4_ADDRESS_BLOCK]
assign_bd_address -offset 0x0000000080000000 -range 1G -target_address_space [get_bd_addr_spaces m10_attention_v2_0/Data_m_axi_gmem0] [get_bd_addr_segs ddr4_0/C0_DDR4_MEMORY_MAP/C0_DDR4_ADDRESS_BLOCK]
assign_bd_address -offset 0x0000000080000000 -range 1G -target_address_space [get_bd_addr_spaces m10_attention_v2_0/Data_m_axi_gmem1] [get_bd_addr_segs ddr4_0/C0_DDR4_MEMORY_MAP/C0_DDR4_ADDRESS_BLOCK]
assign_bd_address -offset 0x0000000080000000 -range 1G -target_address_space [get_bd_addr_spaces m10_attention_v2_0/Data_m_axi_gmem2] [get_bd_addr_segs ddr4_0/C0_DDR4_MEMORY_MAP/C0_DDR4_ADDRESS_BLOCK]
assign_bd_address -offset 0x0000000080000000 -range 1G -target_address_space [get_bd_addr_spaces m10_attention_v2_0/Data_m_axi_gmem3] [get_bd_addr_segs ddr4_0/C0_DDR4_MEMORY_MAP/C0_DDR4_ADDRESS_BLOCK]
assign_bd_address -offset 0x0000000080000000 -range 1G -target_address_space [get_bd_addr_spaces m11_attention_out_0/Data_m_axi_gmem0] [get_bd_addr_segs ddr4_0/C0_DDR4_MEMORY_MAP/C0_DDR4_ADDRESS_BLOCK]
assign_bd_address -offset 0x0000000080000000 -range 1G -target_address_space [get_bd_addr_spaces m11_attention_out_0/Data_m_axi_gmem1] [get_bd_addr_segs ddr4_0/C0_DDR4_MEMORY_MAP/C0_DDR4_ADDRESS_BLOCK]
assign_bd_address -offset 0x0000000080000000 -range 1G -target_address_space [get_bd_addr_spaces m11_attention_out_0/Data_m_axi_gmem2] [get_bd_addr_segs ddr4_0/C0_DDR4_MEMORY_MAP/C0_DDR4_ADDRESS_BLOCK]
assign_bd_address -offset 0x0000000080000000 -range 1G -target_address_space [get_bd_addr_spaces m12_residual_add_0/Data_m_axi_gmem0] [get_bd_addr_segs ddr4_0/C0_DDR4_MEMORY_MAP/C0_DDR4_ADDRESS_BLOCK]
assign_bd_address -offset 0x0000000080000000 -range 1G -target_address_space [get_bd_addr_spaces m12_residual_add_0/Data_m_axi_gmem1] [get_bd_addr_segs ddr4_0/C0_DDR4_MEMORY_MAP/C0_DDR4_ADDRESS_BLOCK]
assign_bd_address -offset 0x0000000080000000 -range 1G -target_address_space [get_bd_addr_spaces m12_residual_add_0/Data_m_axi_gmem2] [get_bd_addr_segs ddr4_0/C0_DDR4_MEMORY_MAP/C0_DDR4_ADDRESS_BLOCK]
assign_bd_address -offset 0x0000000080000000 -range 1G -target_address_space [get_bd_addr_spaces m13_swiglu_0/Data_m_axi_w_down] [get_bd_addr_segs ddr4_0/C0_DDR4_MEMORY_MAP/C0_DDR4_ADDRESS_BLOCK]
assign_bd_address -offset 0x0000000080000000 -range 1G -target_address_space [get_bd_addr_spaces m13_swiglu_0/Data_m_axi_w_gate] [get_bd_addr_segs ddr4_0/C0_DDR4_MEMORY_MAP/C0_DDR4_ADDRESS_BLOCK]
assign_bd_address -offset 0x0000000080000000 -range 1G -target_address_space [get_bd_addr_spaces m13_swiglu_0/Data_m_axi_w_up] [get_bd_addr_segs ddr4_0/C0_DDR4_MEMORY_MAP/C0_DDR4_ADDRESS_BLOCK]
assign_bd_address -offset 0x0000000080000000 -range 1G -target_address_space [get_bd_addr_spaces m13_swiglu_0/Data_m_axi_x] [get_bd_addr_segs ddr4_0/C0_DDR4_MEMORY_MAP/C0_DDR4_ADDRESS_BLOCK]
assign_bd_address -offset 0x0000000080000000 -range 1G -target_address_space [get_bd_addr_spaces m13_swiglu_0/Data_m_axi_y] [get_bd_addr_segs ddr4_0/C0_DDR4_MEMORY_MAP/C0_DDR4_ADDRESS_BLOCK]
assign_bd_address -offset 0x0000000080000000 -range 1G -target_address_space [get_bd_addr_spaces m14_lm_head_0/Data_m_axi_hidden] [get_bd_addr_segs ddr4_0/C0_DDR4_MEMORY_MAP/C0_DDR4_ADDRESS_BLOCK]
assign_bd_address -offset 0x0000000080000000 -range 1G -target_address_space [get_bd_addr_spaces m14_lm_head_0/Data_m_axi_history] [get_bd_addr_segs ddr4_0/C0_DDR4_MEMORY_MAP/C0_DDR4_ADDRESS_BLOCK]
assign_bd_address -offset 0x0000000080000000 -range 1G -target_address_space [get_bd_addr_spaces m14_lm_head_0/Data_m_axi_logits] [get_bd_addr_segs ddr4_0/C0_DDR4_MEMORY_MAP/C0_DDR4_ADDRESS_BLOCK]
assign_bd_address -offset 0x0000000080000000 -range 1G -target_address_space [get_bd_addr_spaces m14_lm_head_0/Data_m_axi_weight] [get_bd_addr_segs ddr4_0/C0_DDR4_MEMORY_MAP/C0_DDR4_ADDRESS_BLOCK]
assign_bd_address -offset 0x00B0000000 -range 64K -target_address_space [get_bd_addr_spaces zynq_ultra_ps_e_0/Data] [get_bd_addr_segs axi_cdma_0/S_AXI_LITE/Reg]
assign_bd_address -offset 0x00B0010000 -range 64K -target_address_space [get_bd_addr_spaces zynq_ultra_ps_e_0/Data] [get_bd_addr_segs m06_rmsnorm_0/s_axi_control/Reg]
assign_bd_address -offset 0x00B0020000 -range 64K -target_address_space [get_bd_addr_spaces zynq_ultra_ps_e_0/Data] [get_bd_addr_segs m09_kv_cache_update_0/s_axi_control/Reg]
assign_bd_address -offset 0x00B0030000 -range 64K -target_address_space [get_bd_addr_spaces zynq_ultra_ps_e_0/Data] [get_bd_addr_segs m13_swiglu_0/s_axi_control/Reg]
assign_bd_address -offset 0x00B0040000 -range 64K -target_address_space [get_bd_addr_spaces zynq_ultra_ps_e_0/Data] [get_bd_addr_segs m05_embedding_0/s_axi_ctrl/Reg]
assign_bd_address -offset 0x00B0050000 -range 64K -target_address_space [get_bd_addr_spaces zynq_ultra_ps_e_0/Data] [get_bd_addr_segs m07_qkv_projection_0/s_axi_control/Reg]
assign_bd_address -offset 0x00B0060000 -range 64K -target_address_space [get_bd_addr_spaces zynq_ultra_ps_e_0/Data] [get_bd_addr_segs m11_attention_out_0/s_axi_control/Reg]
assign_bd_address -offset 0x00B0070000 -range 64K -target_address_space [get_bd_addr_spaces zynq_ultra_ps_e_0/Data] [get_bd_addr_segs m12_residual_add_0/s_axi_control/Reg]
assign_bd_address -offset 0x00B0080000 -range 64K -target_address_space [get_bd_addr_spaces zynq_ultra_ps_e_0/Data] [get_bd_addr_segs m14_lm_head_0/s_axi_control/Reg]
assign_bd_address -offset 0x00B0090000 -range 64K -target_address_space [get_bd_addr_spaces zynq_ultra_ps_e_0/Data] [get_bd_addr_segs m08_rope_v2_0/s_axi_control/Reg]
assign_bd_address -offset 0x00B00A0000 -range 64K -target_address_space [get_bd_addr_spaces zynq_ultra_ps_e_0/Data] [get_bd_addr_segs m10_attention_v2_0/s_axi_control/Reg]

validate_bd_design
save_bd_design
